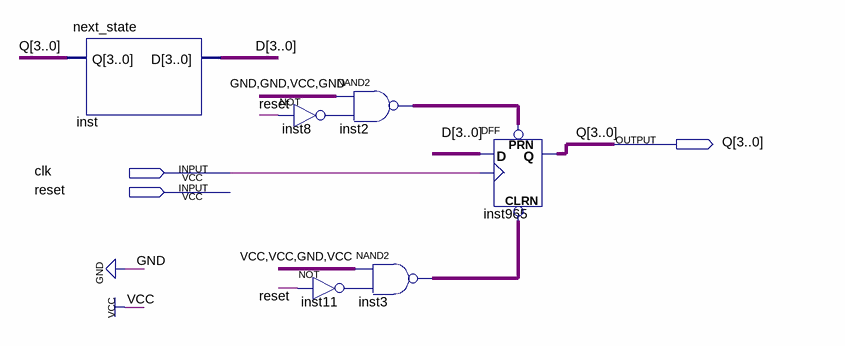
[diagram p0: schematic sheet]
// Quartus schematic state_machine.bdf as structural Verilog: 6 symbols, 3 pins
module state_machine (
  input  clk,
  input  reset,
  output [3:0] Q
);

  wire inst8_out, inst11_out;
  wire [3:0] D, inst2_out, inst3_out;

  next_state inst (.Q(Q), .D(D));
  not inst8 (inst8_out, reset);
  not inst11 (inst11_out, reset);
  assign inst2_out = ~(4'b0010 & {4{inst8_out}});  // NAND2 inst2, 4 bits wide
  assign inst3_out = ~(4'b1101 & {4{inst11_out}});  // NAND2 inst3, 4 bits wide
  DFF inst965[3:0] (.CLRN(inst3_out), .CLK(clk), .D(D), .PRN(inst2_out), .Q(Q));
endmodule
